# EAGLE design regulator (EAGLE 9.6.2)

## Sheet 1 of 2: Power
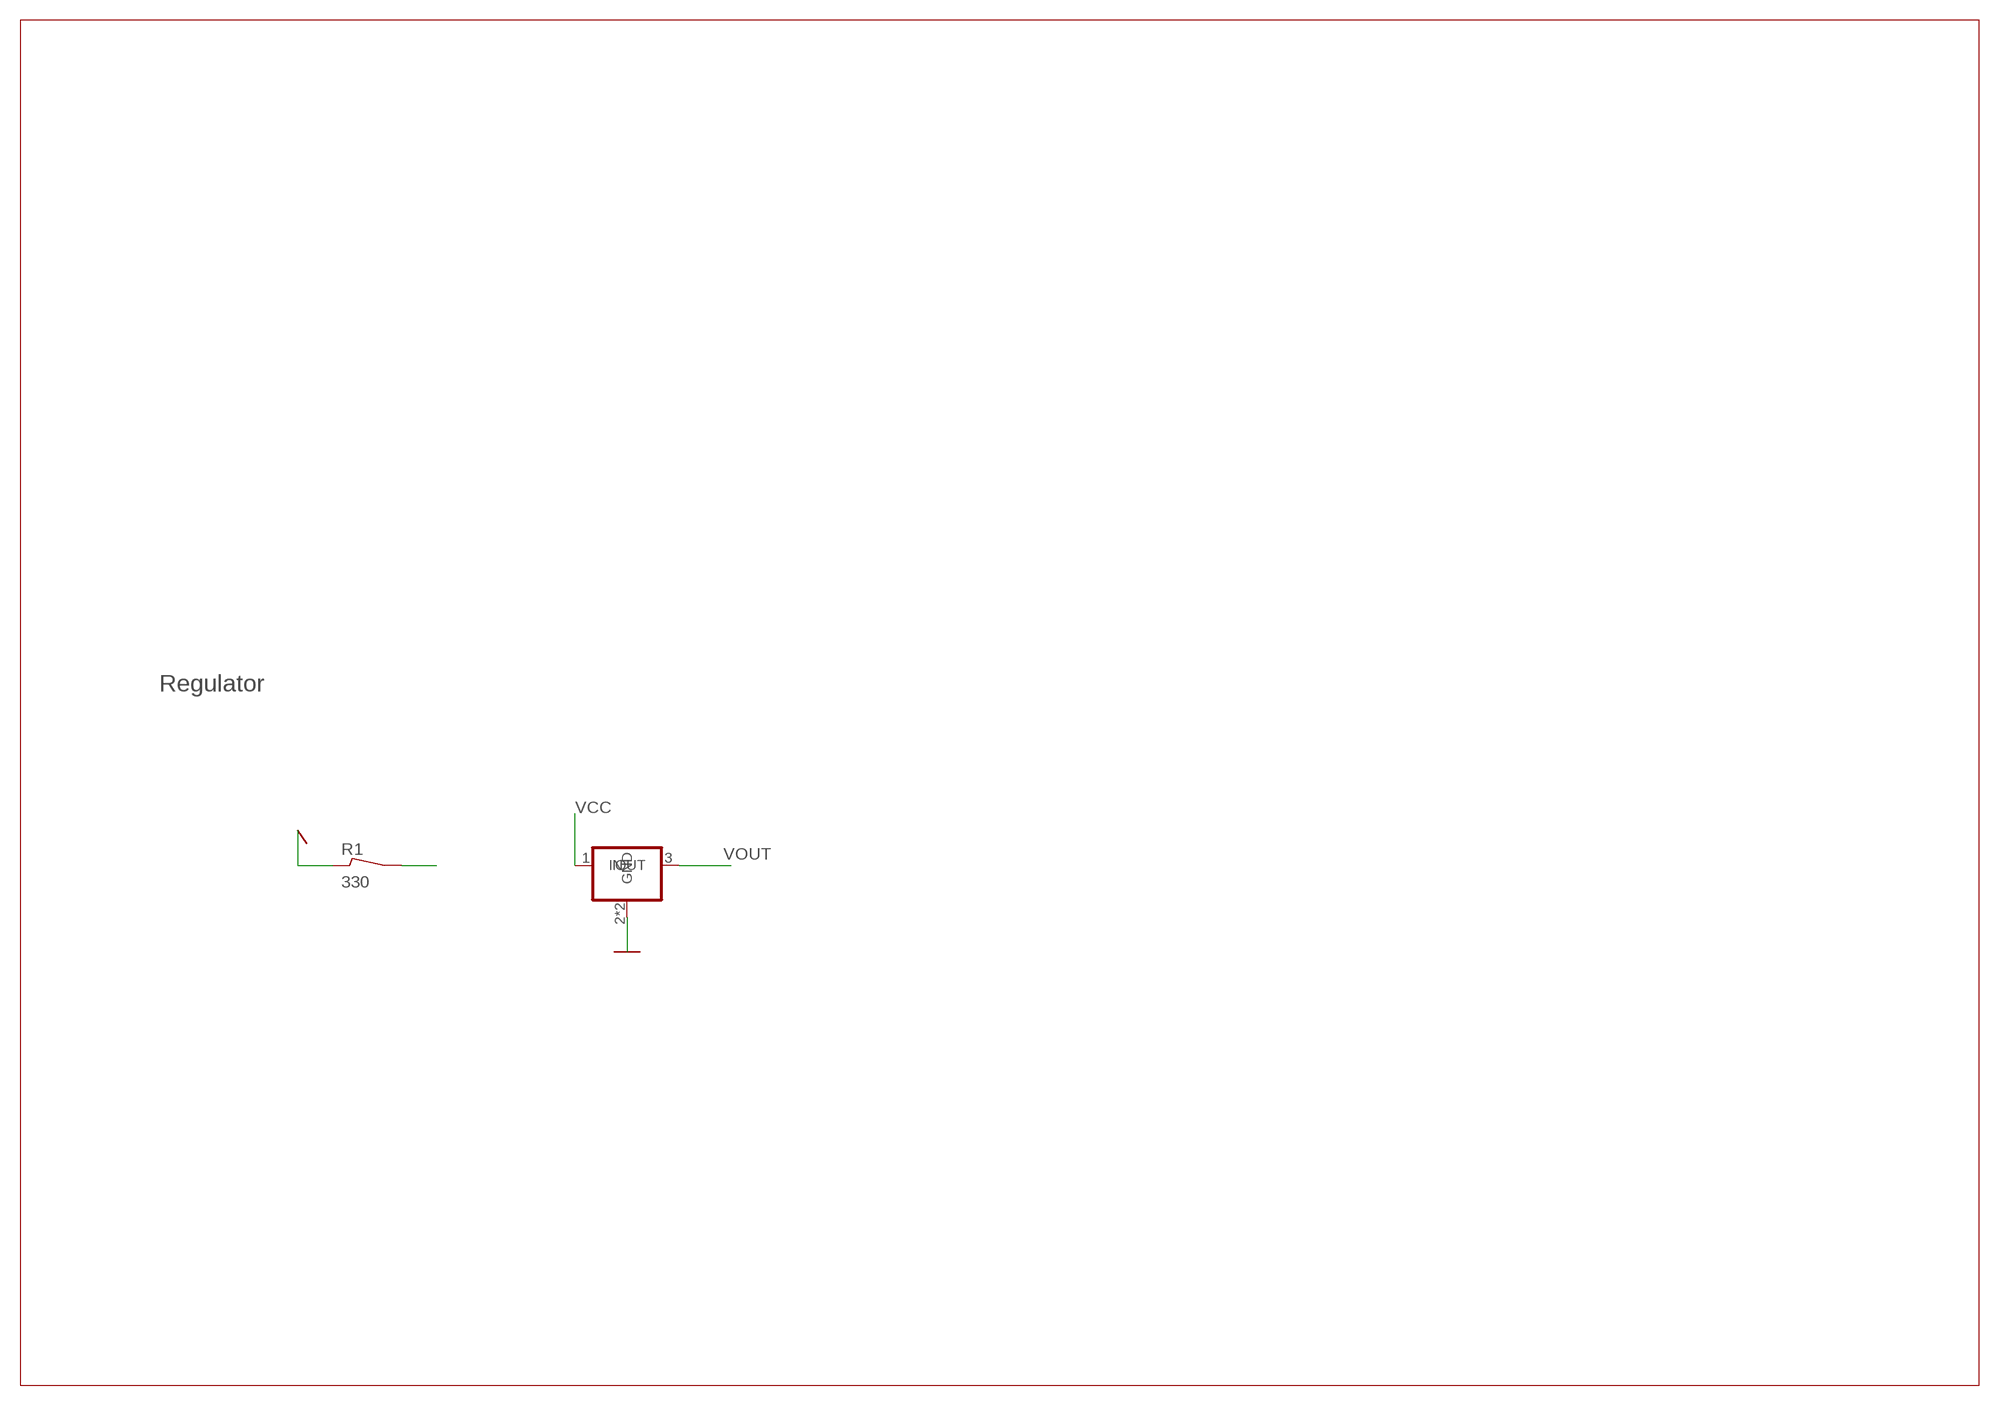
[diagram p0: schematic, sheet 1]

### Parts
R1  330  R-US_R0805  [R0805]
U1  78XX05SOT223  [SOT223]

### Nets
GND: U1.2(GND) U1.4(GND) ; also sheet 2
N$1: R1.2
VCC: R1.1 U1.1(IN) ; also sheet 2
VOUT: U1.3(OUT) ; also sheet 2

### Notes on the sheet
- Regulator

## Sheet 2 of 2: Buffer
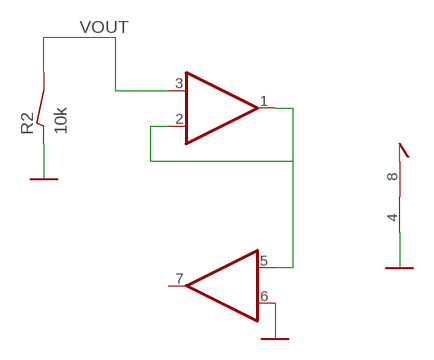
[diagram p1: schematic, sheet 2]

### Parts
R2  10k  R-US_0207/10  [0207/10]
U2  LM358D  [SO8]

### Nets
AOUT: U2.1(A:OUT) U2.2(A:-IN) U2.5(B:+IN)
GND: R2.1 U2.4(P:V-) U2.6(B:-IN) ; also sheet 1
VCC: U2.8(P:V+) ; also sheet 1
VOUT: R2.2 U2.3(A:+IN) ; also sheet 1
Unconnected: U2.7(B:OUT)

## Library data of the parts
R1 R2 = rcl:R-US_
U1 = reg:78XX; MPN: LM78M05
U2 = reg:LM358

## Board
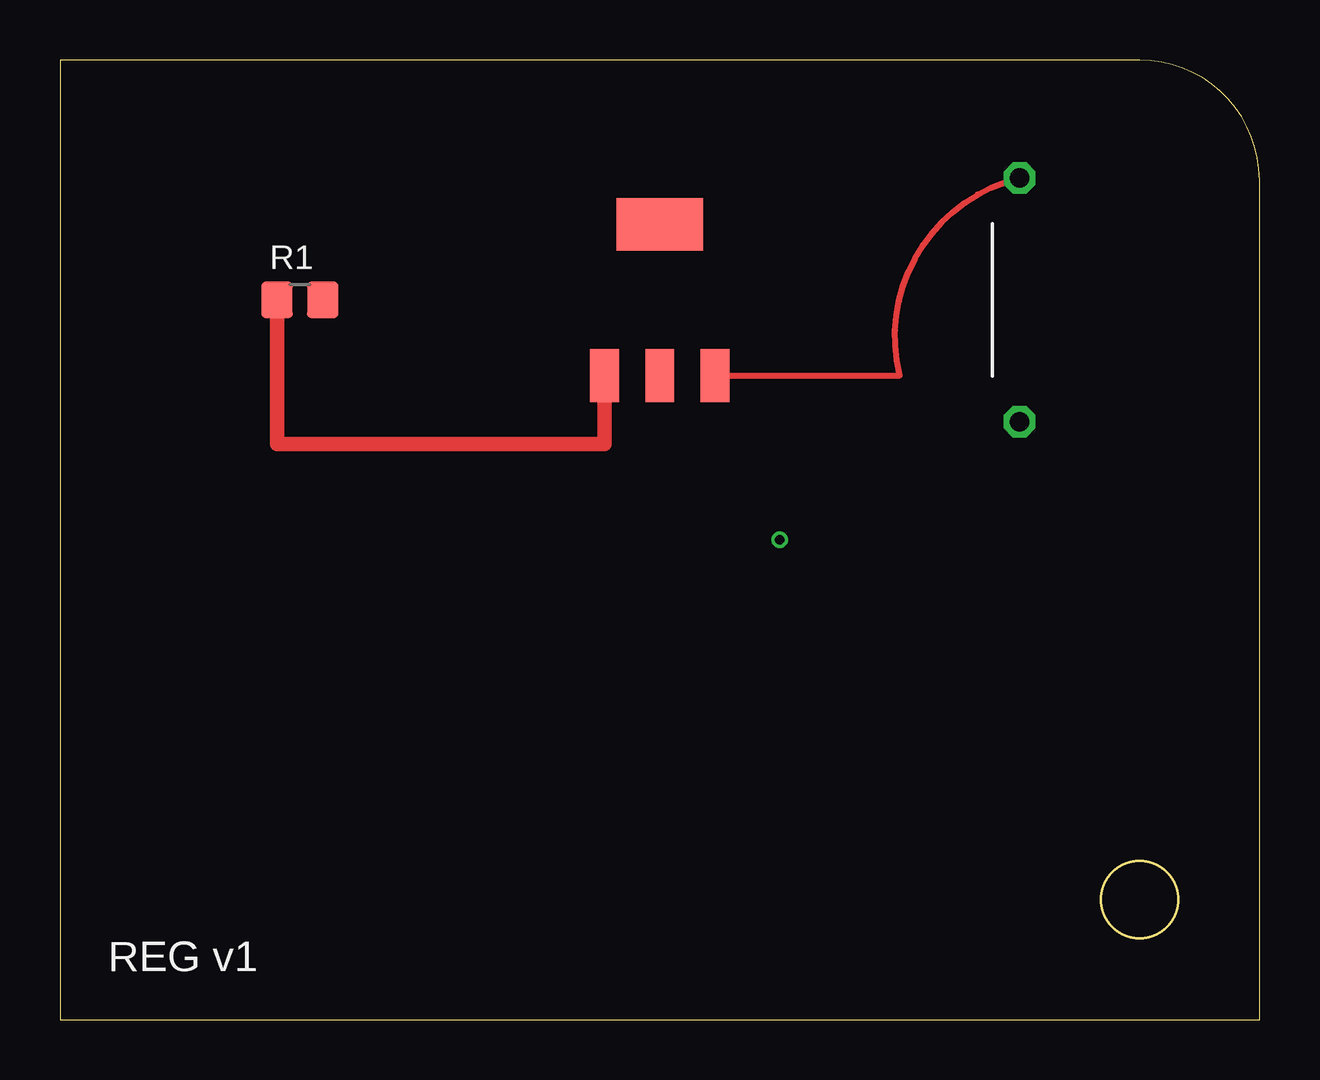
[diagram p2: board, top side]
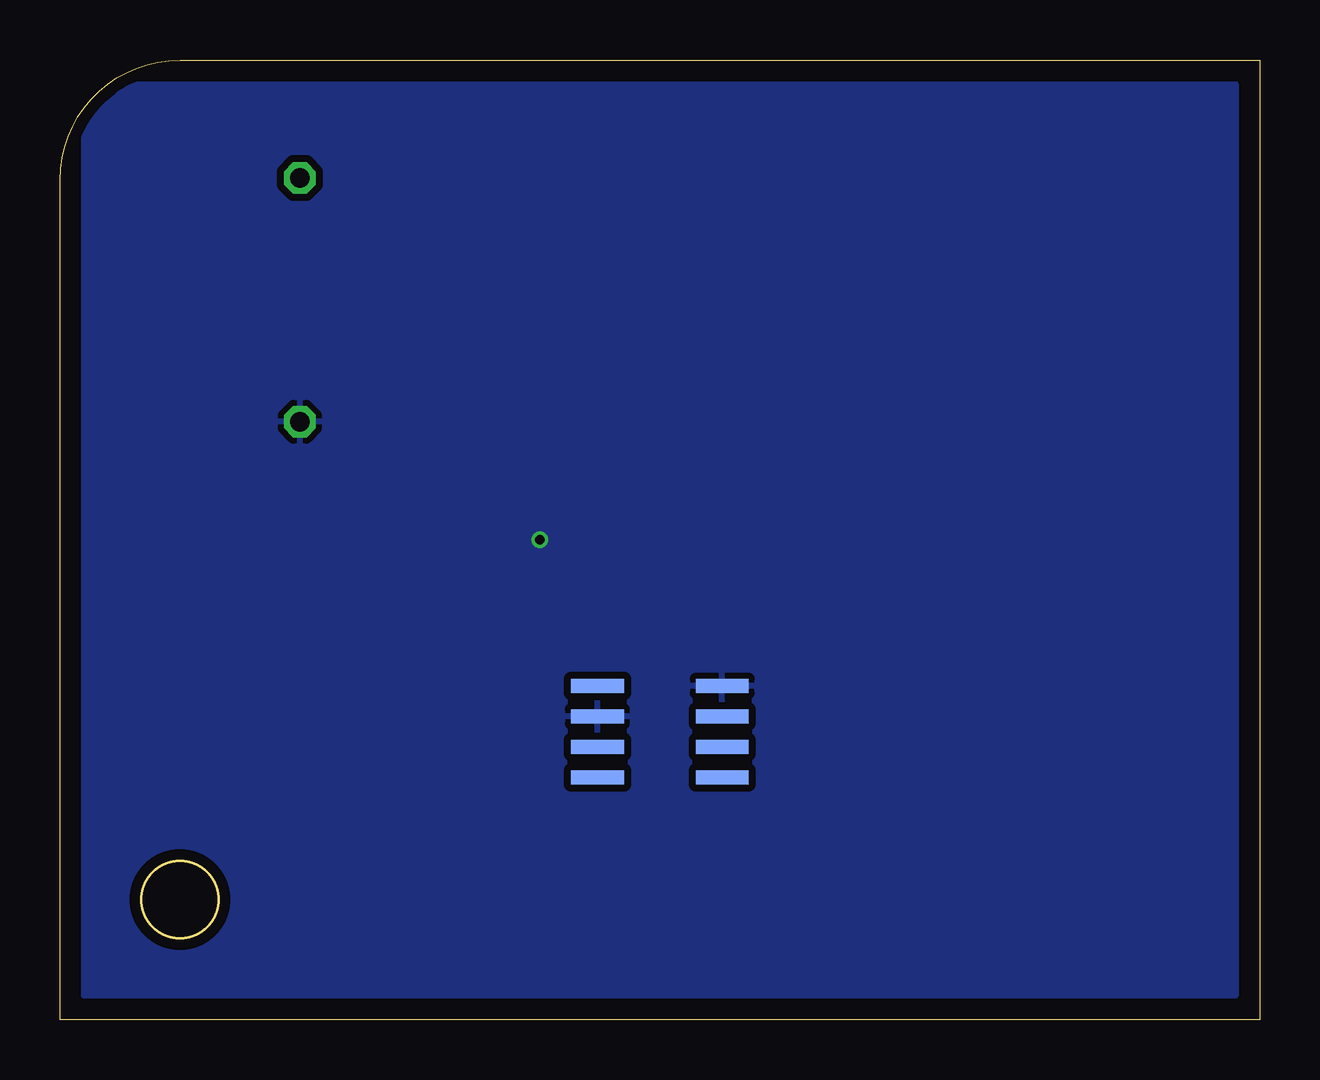
[diagram p3: board, bottom side, seen from below]

Size 50 x 40 mm. Coordinates in mm from the lower left corner, seen from the top.
Outline: 0,0 50,0 50,35 arc90 45,40 0,40 0,0
Outline: circle at 45,5 radius 1.6
Copper layers (1*16): Top / Bottom
Design rules "fixture": minimum track width 10mil, minimum drill 0.35mm, track to track 8mil, track to pad 8mil, pad to pad 8mil, via to via 8mil, copper to edge 0.5mm, minimum pad ring 10mil, minimum via ring 6mil

### Footprints (pad centres in the part's own frame; a part is rotated, then mirrored left to right if it is on the bottom)
R0805 = smd 1.3 x 1.5: 1 -0.95,0; 2 0.95,0
0207/10 = drill 0.813 octagon: 1 -5.08,0; 2 5.08,0
SOT223 = smd 1.2 x 2.2: 1 -2.3,-3.15; 2 0,-3.15; 3 2.3,-3.15 | smd 3.6 x 2.2: 4 0,3.15
SO8 = smd 0.6 x 2.2: 1 -1.905,-2.6; 2 -0.635,-2.6; 3 0.635,-2.6; 4 1.905,-2.6; 5 1.905,2.6; 6 0.635,2.6; 7 -0.635,2.6; 8 -1.905,2.6

### Placement (x,y rotation side)
R1  10,30 0 top
R2  40,30 90 top
U1  25,30 0 top
U2  25,12 90 bottom

### Tracks (layer width: path | path; a pad name or v marks a point on that pad's centre or on a via)
GND  (via drill 0.4)
  other vias: 30,20
  pour Bottom (isolate 0.3): 1,1 49,1 49,39 1,39
VCC
  Top 0.6: R1.1 9.05,24 22.7,24 U1.1
VOUT
  Top 0.254: U1.3 35,26.85 arc-90 R2.2

### Text on the board
layer 21: REG v1